# Altium project PGS-System.PrjPcb (part 4 of 16)

## Sheet BUCK_CONVERTER_SHEET1.SchDoc
size A4; SheetNumber: 3; SheetTotal: 27
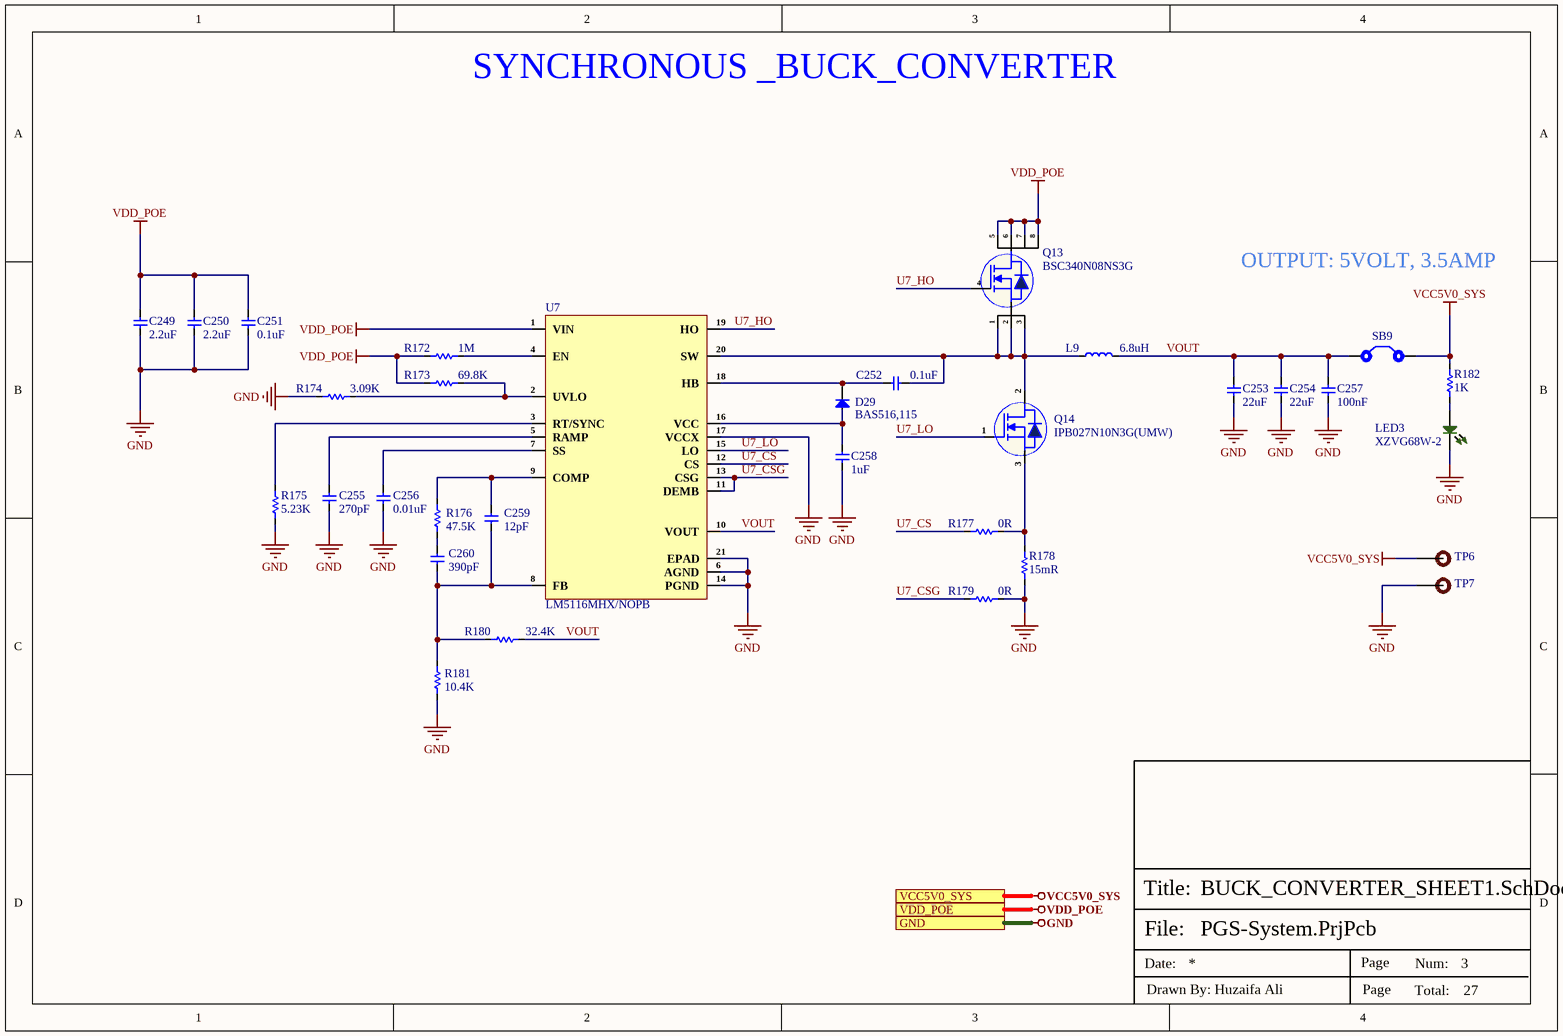
[diagram p2: BUCK_CONVERTER_SHEET1.SchDoc]

### Parts
C249  2.2uF  [Cap-0805]
C250  2.2uF  [Cap-0805]
C251  0.1uF  [Cap-0603]
C252  0.1uF  [Cap-0603]
C253  22uF  [Cap-0805]
C254  22uF  [Cap-0805]
C255  270pF  [Cap-0402]
C256  0.01uF  [Cap-0402]
C257  100nF  [CAP-0201]
C258  1uF  [Cap-0603]
C259  12pF  [Cap-0402]
C260  390pF  [Cap-0402]
D29  BAS516,115  [SOD-523]
L9  6.8uH  [IHLP3232DZER6R8M11]
LED3  XZVG68W-2  [LED-0402]
Q13  BSC340N08NS3G  [PG-TDSON-8]
Q14  IPB027N10N3G(UMW)  [TO-263]
R172  1M  [Res-0603]
R173  69.8K  [Res-0603]
R174  3.09K  [RES-0805]
R175  5.23K  [RES-0805]
R176  47.5K  [Res-0402]
R177  0R  [Res-0603]
R178  15mR  [Res-1206]
R179  0R  [Res-0603]
R180  32.4K  [RES-0805]
R181  10.4K  [RES-0805]
R182  1K  [Res-0402]
SB9  Solder Bridge_1206  [SOLDER BRIDGE-1206_]  (value not drawn)  (no BOM)
TP6  TEST POINT 0.5mm Dia  [Test-point - 0.5mm]  (value not drawn)  (no BOM)
TP7  TEST POINT 0.5mm Dia  [Test-point - 0.5mm]  (value not drawn)  (no BOM)
U7  LM5116MHX/NOPB  [20-HTSSOP]

### Ports
GND (see DDR3_SDRAM_SHEET[5D], DEBUG_UART_INTERFACE[3D], DIGITAL_MEMS_INTERFACE[3C], eMMC_INTERFACE[3D], ETH_PoE-PD_INTERFACE[4D], ETH_SWITCH_INTERFACE[5D], IR-CUT_LIGHT SENSOR_SHEET[3D], MIPI TO HDMI_MODULE[3D], MIPI-CSI_RXX_INTERFACE[3C], PoE_PSE_CONTROLLER[5D], POWER_LDO_SHEET[3D], POWER_PMIC_RK809_CODEC[3C], POWER_PMIC_RK809_DC DC[3D], POWER_PMIC_RK809_LDO[4C], POWER_PMIC_RK809_MGM[3D], RV1126_AUDIO_SHEET[3D], RV1126_DRAM_SHEET[4C], RV1126_eMMC_SPI-FLASH[3C], RV1126_ETHERNET_SHEET[3D], RV1126_OSC-PLL-PMUIO[3C], RV1126_POWER_SHEET[1D], RV1126_SARADC_SHEET[3C], RV1126_SDMMC_SHEET[3C], SPEARKER_INTERFACE_SHEET[3C], SPI_FLASH_INTERFACE[3D], USB2.0_DEBUG_UART[3D]), VCC5V0_SYS (see IR-CUT_LIGHT SENSOR_SHEET[3D], MIPI TO HDMI_MODULE[3D], POWER_LDO_SHEET[3D], POWER_PMIC_RK809_CODEC[3C], POWER_PMIC_RK809_DC DC[3D], POWER_PMIC_RK809_LDO[4C], POWER_PMIC_RK809_MGM[3D], RV1126_OSC-PLL-PMUIO[3C], USB2.0_DEBUG_UART[3D]), VDD_POE (see ETH_PoE-PD_INTERFACE[4D], PoE_PSE_CONTROLLER[5D])

### Nets
GND: C249.1 C250.1 C251.1 C253.1 C254.1 C255.1 C256.1 C257.1 C258.2 LED3.2 R174.1 R175.1 R178.1 R179.2 R181.1 TP7.1 U7.6(AGND) U7.14(PGND) U7.17(VCCX) U7.21(EPAD) ; port GND  [project net KSENSD]
VCC5V0_SYS: R182.2 SB9.2 TP6.1 ; port VCC5V0_SYS
VDD_POE: C249.2 C250.2 C251.2 Q13.5(D) Q13.6(D) Q13.7(D) Q13.8(D) R172.1 R173.1 U7.1(VIN) ; port VDD_POE
U7_CS: R177.1 U7.12(CS)
U7_CSG: R179.1 U7.11(DEMB) U7.13(CSG)
U7_HO: Q13.4(G) U7.19(HO)
U7_LO: Q14.1(G) U7.15(LO)
VOUT: C253.2 C254.2 C257.2 L9.2 R180.2 SB9.1 U7.10(VOUT)
NetC252_1: C252.1 D29.2(K) U7.18(HB)
NetC252_2: C252.2 L9.1 Q13.1(S) Q13.2(S) Q13.3(S) Q14.2(D) U7.20(SW)
NetC255_2: C255.2 U7.5(RAMP)
NetC256_2: C256.2 U7.7(SS)
NetC258_1: C258.1 D29.1(A) U7.16(VCC)
NetC259_1: C259.1 C260.1 R180.1 R181.2 U7.8(FB)
NetC259_2: C259.2 R176.2 U7.9(COMP)
NetC260_2: C260.2 R176.1
NetLED3_1: LED3.1 R182.1
NetQ14_3: Q14.3(S) R177.2 R178.2
NetR172_2: R172.2 U7.4(EN)
NetR173_2: R173.2 R174.2 U7.2(UVLO)
NetR175_2: R175.2 U7.3(RT/SYNC)

### Notes on the sheet
- SYNCHRONOUS _BUCK_CONVERTER
- OUTPUT: 5VOLT, 3.5AMP
- File:
- Title:
- Date:
- Page
- Num:
- Total:
- Drawn By: Huzaifa Ali

### Library data of the parts
C249 C250 = GRM21BD72A225KE01L: CAP CER 2.2UF 100V X7T 0805; Manufacturer: Murata; Item Type: Capacitor; Supplier 1: Digi-Key; Manufacturer Part Number: GRM21BD72A225KE01L; RoHS: No; Category: Ceramic Capacitors; Stock 1: 2439; Pricing 1: 1=0.55000, 10=0.38600, 50=0.29220, 100=0.25440, 500=0.18846, 1000=0.16020 (USD); RoHS Compliant: Yes; LCSC Part Number: C2981733; ComponentLink1Description: LCSC; ComponentLink1URL: https://www.lcsc.com/product-detail/Multilayer-Ceramic-Capacitors-MLCC-SMD-SMT_Murata-Electronics-GRM21BD72A225KE01L_C2981733.html; Supplier Part Number 1: 490-GRM21BD72A225KE01LCT-ND
C251 C252 = CC0603KRX7R0BB104: as C119 on sheet ETH_PoE-PD_INTERFACE; Supplier 1: Digi-Key; Manufacturer Part Number: CC0603KRX7R0BB104; RoHS: Yes; Category: Ceramic Capacitors; Stock 1: 60476; Pricing 1: 1=0.19000, 10=0.13500, 50=0.07680, 100=0.06370, 500=0.04466, 1000=0.03696 (USD); Mount: Surface Mount; Case/Package: 0603; Case Code (Metric): 1608; Case Code (Imperial): 0603; Weight: 7.1E-05oz; Min Operating Temperature: -55°C; Max Operating Temperature: 125°C; Package Quantity: 4000; Voltage Rating: 100V; Packaging: Tape and Reel; Dielectric: X7R; Termination: SMD/SMT; Resistor Type: Ceramic; Voltage Rating (DC): 100V; Series: CC; Length: 0.063inch; Width: 0.031inch; Thickness: 0.035inch; Depth: 0.8mm; Lead Free: Lead Free; RoHS Compliant: Yes; ComponentLink1URL: https://datasheet.ciiva.com/6277/mlccorderingcode-6277030.pdf?src-supplier=Digi-Key; ComponentLink1Description: https://datasheet.ciiva.com/6277/mlccorderingcode-6277030.pdf?src-supplier=Digi-Key; ComponentLink2URL: https://datasheet.ciiva.com/6277/mlccorderingcode-6277081.pdf?src-supplier=Digi-Key; ComponentLink2Description: https://datasheet.ciiva.com/6277/mlccorderingcode-6277081.pdf?src-supplier=Digi-Key; ComponentLink3URL: https://datasheet.ciiva.com/6277/mlccorderingcode-6277082.pdf?src-supplier=Digi-Key; ComponentLink3Description: https://datasheet.ciiva.com/6277/mlccorderingcode-6277082.pdf?src-supplier=Digi-Key; Supplier Part Number 1: 311-1523-1-ND; LCSC Part Number: C113803
C253 C254 = GRM21BR61E226ME44L: CAP CER 22UF 25V X5R 0805; Manufacturer: Murata; Material: Ceramic; Tolerance: 20%; Item Type: Capacitor; Supplier 1: Arrow Electronics; Manufacturer Part Number: GRM21BR61E226ME44L; RoHS: Yes; Category: Ceramic Capacitors; Stock 1: 21193; Pricing 1: 1=0.45930, 10=0.35000, 25=0.33950, 50=0.26910, 100=0.22090, 250=0.21320, 500=0.16760, 1000=0.14640, 3000=0.11710, 6000=0.10550, 15000=0.10450 (USD); Mount: Surface Mount; Case/Package: 0805; Case Code (Metric): 2012; Case Code (Imperial): 0805; Weight: 0.000335oz; Min Operating Temperature: -55°C; Max Operating Temperature: 85°C; Capacitance: 22uF; Voltage Rating: 25V; Packaging: Tape and Reel; Dielectric: X5R; Voltage: 25V; Termination: SMD/SMT; Resistor Type: Ceramic; Voltage Rating (DC): 25V; Package Quantity: 3000; Series: GRM; Construction: Flat; Length: 2mm; Width: 1.25mm; Height: 1.25mm; Thickness: 0.057inch; Depth: 1.25mm; REACH SVHC: No SVHC; Lead Free: Lead Free; RoHS Compliant: Yes; ComponentLink1URL: https://datasheet.ciiva.com/22787/1747471-22787265.pdf?src-supplier=Farnell; ComponentLink1Description: https://datasheet.ciiva.com/22787/1747471-22787265.pdf?src-supplier=Farnell; ComponentLink2URL: https://datasheet.ciiva.com/7719/1747471-7719095.pdf?src-supplier=Element14; ComponentLink2Description: https://datasheet.ciiva.com/7719/1747471-7719095.pdf?src-supplier=Element14; ComponentLink3URL: https://datasheet.ciiva.com/28584/1747471-28584199.pdf?src-supplier=Element14; ComponentLink3Description: https://datasheet.ciiva.com/28584/1747471-28584199.pdf?src-supplier=Element14; Supplier Part Number 1: GRM21BR61E226ME44L; LCSC Part Number: C86816
C255 = CC0402JRNPO9BN271: CAP CER 270PF 50V C0G/NPO 0402; Manufacturer: Yageo; Item Type: Capacitor; Supplier: Future Electronics; LCSC Part Number: C107003; Manufacturer Part Number: CC0402JRNPO9BN271; RoHS: Yes; Stock: 10000; Pricing: 10000=0.004, 40000=0.0038, 150000=0.0036, 250000=0.0035, 500000=0.0033 (USD); Halogen Free: 5694HalogenFree; ComponentLink1URL: http://www.mouser.com/ds/2/447/Yageo_UPY-GP_NP0_16V-to-50V_9-358835.pdf?src-supplier=Mouser; ComponentLink1Description: http://www.mouser.com/ds/2/447/Yageo_UPY-GP_NP0_16V-to-50V_9-358835.pdf?src-supplier=Mouser; ComponentLink2URL: http://www.yageo.com/documents/recent/UPY-GP_NP0_16V-to-50V_6.pdf?src-supplier=Avnet; ComponentLink2Description: http://www.yageo.com/documents/recent/UPY-GP_NP0_16V-to-50V_6.pdf?src-supplier=Avnet; ComponentLink3URL: https://datasheet.octopart.com/CC0402JRNPO9BN271-Yageo-datasheet-137875056.pdf?src-supplier=Newark; ComponentLink3Description: https://datasheet.octopart.com/CC0402JRNPO9BN271-Yageo-datasheet-137875056.pdf?src-supplier=Newark; ComponentLink4URL: http://www.yageo.com/documents/recent/UPY-GP_NP0_16V-to-50V_16.pdf?src-supplier=Digikey; ComponentLink4Description: http://www.yageo.com/documents/recent/UPY-GP_NP0_16V-to-50V_16.pdf?src-supplier=Digikey; ComponentLink5URL: http://www.yageo.com/exep/pages/download/literatures/ProductSelectionGuide%202014_Final_2.pdf?src-supplier=Digikey; ComponentLink5Description: http://www.yageo.com/exep/pages/download/literatures/ProductSelectionGuide%202014_Final_2.pdf?src-supplier=Digikey; ComponentLink6URL: https://datasheet.octopart.com/CC0402JRNPO9BN271-Yageo-datasheet-136957424.pdf?src-supplier=Future+Electronics; ComponentLink6Description: https://datasheet.octopart.com/CC0402JRNPO9BN271-Yageo-datasheet-136957424.pdf?src-supplier=Future+Electronics; ComponentLink7URL: https://www.verical.com/server-webapp/html/getDatasheet?partID=755863&src-supplier=Verical; ComponentLink7Description: https://www.verical.com/server-webapp/html/getDatasheet?partID=755863&src-supplier=Verical; ComponentLink8URL: http://www.yageo.com/documents/recent/UPY-GP_NP0_16V-to-50V_9.pdf?src-supplier=Future+Electronics; ComponentLink8Description: http://www.yageo.com/documents/recent/UPY-GP_NP0_16V-to-50V_9.pdf?src-supplier=Future+Electronics
C256 = CC0402KRX5R8BB103: CAP CER 10000PF 25V X5R 0402; Manufacturer: Yageo; Item Type: Capacitor; Supplier 1: Future Electronics; Manufacturer Part Number: CC0402KRX5R8BB103; RoHS: Yes; Category: Ceramic Capacitors; Stock 1: 140000; Pricing 1: 10000=0.00290, 40000=0.00270, 150000=0.00260, 250000=0.00250, 500000=0.00240 (USD); RoHS Compliant: Yes; Supplier Part Number 1: 2101932; LCSC Part Number: C576726; ComponentLink1Description: LCSC; ComponentLink1URL: https://www.lcsc.com/product-detail/Multilayer-Ceramic-Capacitors-MLCC-SMD-SMT_YAGEO-CC0402KRX5R8BB103_C576726.html
C257 = CC0201KRX5R6BB104: CAP CER 0.1UF 10V X5R 0201; Manufacturer: Yageo; Tolerance: 10%; Supplier 1: Mouser; Manufacturer Part Number: CC0201KRX5R6BB104; RoHS: Yes; Category: Ceramic Capacitors; Stock 1: 824403; Pricing 1: 1=0.10000, 10=0.02400, 50=0.02400, 100=0.01900, 1000=0.01100, 10000=0.00900 (USD); Mount: Surface Mount; Case/Package: 0201; Case Code (Imperial): 0201; Case Code (Metric): 0603; Weight: 6E-06oz; Min Operating Temperature: -55°C; Max Operating Temperature: 85°C; Capacitance: 100nF; Dielectric: X5R; Voltage Rating (DC): 10V; Packaging: Tape and Reel; Termination: SMD/SMT; Resistor Type: Ceramic; Voltage Rating: 10V; Series: CC; Construction: Flat; Length: 0.6mm; Width: 0.012inch; Height: 0.3mm; Thickness: 0.013inch; Depth: 0.3mm; Radiation Hardening: No; Lead Free: Lead Free; Halogen Free: Halogen Free; RoHS Compliant: Yes; ComponentLink1URL: https://datasheet.ciiva.com/11587/upy-gphc-x5r-4v-to-50v-12-11587190.pdf?src-supplier=Avnet; ComponentLink1Description: https://datasheet.ciiva.com/11587/upy-gphc-x5r-4v-to-50v-12-11587190.pdf?src-supplier=Avnet; Supplier Part Number 1: 603-CC201KRX5R6BB104; LCSC Part Number: C190183
C258 = CL10A105KB8NNNC: CAP CER 1UF 50V X5R 0603; Manufacturer: Samsung; Material: 4241ConductorMaterial; Tolerance: 10%; Item Type: Capacitor; Supplier: Avnet; Supplier Part Number: CL10A105KB8NNNC; Manufacturer Part Number: CL10A105KB8NNNC; RoHS: Yes; Category: Ceramic Capacitors; Stock: 780446; Pricing: 4000=0.01632, 8000=0.01595, 16000=0.01557, 24000=0.0152, 32000=0.01482 (USD); Mounting Technology: Surface Mount; Case/Package: 0603; Case Code (Metric): 1608; Case Code (Imperial): 0603; Min Operating Temperature: -55°C; Max Operating Temperature: 85°C; Packaging: Tape and Reel; Value: 1uF; Voltage Rating: 50V; Dielectric: X5R; Series: CL; Voltage Rating (DC): 50V; Length: 1.6mm; Depth: 0.8mm; Radiation Hardening: No; RoHS Compliant: Yes; ComponentLink1URL: https://datasheet.ciiva.com/26877/getdatasheetpartid-753736-26877879.pdf?src-supplier=Verical; ComponentLink1Description: https://datasheet.ciiva.com/26877/getdatasheetpartid-753736-26877879.pdf?src-supplier=Verical; LCSC Part Number: C15849
C259 = GJM1555C1H120GB01D: CAP CER 12PF 50V C0G/NP0 0402; Manufacturer: Murata; Tolerance: 2%; Dielectric: C0G; Supplier 1: Digi-Key; Manufacturer Part Number: GJM1555C1H120GB01D; RoHS: Yes; Category: Ceramic Capacitors; Stock 1: 266975; Pricing 1: 1=0.18000, 10=0.12600, 50=0.07560, 100=0.06390, 500=0.04370, 1000=0.03865, 2500=0.03698, 5000=0.03361 (USD); Mount: Surface Mount; Case/Package: 0402; Case Code (Imperial): 0402; Case Code (Metric): 1005; Min Operating Temperature: -55°C; Max Operating Temperature: 125°C; Capacitance: 12pF; Voltage Rating: 50V; Voltage Rating (DC): 50V; Packaging: Tape and Reel; Package Quantity: 10000; Termination: SMD/SMT; Series: GJM; Construction: Flat; Length: 1mm; Width: 0.5mm; Height: 0.5mm; Thickness: 0.022inch; Depth: 0.5mm; Radiation Hardening: No; Lead Free: Lead Free; RoHS Compliant: Yes; ComponentLink1URL: https://datasheet.ciiva.com/11608/product-11608208.pdf?src-supplier=Avnet; ComponentLink1Description: https://datasheet.ciiva.com/11608/product-11608208.pdf?src-supplier=Avnet; ComponentLink2URL: https://datasheet.ciiva.com/29542/partnumbering-e-01-29542716.pdf?src-supplier=Digi-Key; ComponentLink2Description: https://datasheet.ciiva.com/29542/partnumbering-e-01-29542716.pdf?src-supplier=Digi-Key; ComponentLink3URL: https://datasheet.ciiva.com/29542/partnumbering-e-01-29542715.pdf?src-supplier=Digi-Key; ComponentLink3Description: https://datasheet.ciiva.com/29542/partnumbering-e-01-29542715.pdf?src-supplier=Digi-Key; ComponentLink4URL: https://datasheet.ciiva.com/29542/partnumbering-e-01-29542717.pdf?src-supplier=Digi-Key; ComponentLink4Description: https://datasheet.ciiva.com/29542/partnumbering-e-01-29542717.pdf?src-supplier=Digi-Key; Supplier Part Number 1: 490-8078-1-ND; LCSC Part Number: C161305
C260 = CGA2B2C0G1H391J050BA: CAP CER 390PF 50V C0G 0402; Manufacturer: TDK; Item Type: Capacitors; Supplier: Digikey; Supplier Part Number: 445-5603-1-ND; Manufacturer Part Number: CGA2B2C0G1H391J050BA; RoHS: Yes; Stock: 103846; Pricing: 1=0.1, 10=0.048, 50=0.0278, 100=0.0216, 500=0.01622, 1000=0.01275, 2500=0.01159, 5000=0.01066 (USD); ComponentLink1URL: https://datasheet.ciiva.com/24219/cga2b2c0g1h391j050ba-265720-24219960.pdf?src-supplier=Mouser; ComponentLink1Description: https://datasheet.ciiva.com/24219/cga2b2c0g1h391j050ba-265720-24219960.pdf?src-supplier=Mouser; ComponentLink2URL: https://datasheet.ciiva.com/7975/1807242-7975259.pdf?src-supplier=Element14; ComponentLink2Description: https://datasheet.ciiva.com/7975/1807242-7975259.pdf?src-supplier=Element14
D29 = BAS516,115: DIODE GEN PURP 100V 250MA SOD523; Manufacturer: Nexperia; Max Reverse Current: 50uA; Max Forward Surge Current (Ifsm): 4A; Value: 1pF; Supplier: Future Electronics; LCSC Part Number: C10037; Manufacturer Part Number: BAS516,115; RoHS: Yes; Item Type: Diode; Stock: 4176000; Pricing: 3000=0.0153, 12000=0.0146, 30000=0.0142, 75000=0.0138, 120000=0.0132 (USD); Pins: 2NUMBER; Max Repetitive Reverse Voltage (Vrrm): 100V; Forward Current: 250mA; Reverse Voltage: 100V; Height: 650um; RoHS Compliant: Yes; ComponentLink1URL: http://www.farnell.com/datasheets/1856332.pdf?src-supplier=Farnell; ComponentLink1Description: http://www.farnell.com/datasheets/1856332.pdf?src-supplier=Farnell; ComponentLink2URL: https://datasheet.octopart.com/BAS516%2C115-Nexperia-datasheet-32749520.pdf?src-supplier=Newark; ComponentLink2Description: https://datasheet.octopart.com/BAS516%2C115-Nexperia-datasheet-32749520.pdf?src-supplier=Newark; ComponentLink3URL: https://assets.nexperia.com/documents/data-sheet/BAS16_SER.pdf?src-supplier=Digikey; ComponentLink3Description: https://assets.nexperia.com/documents/data-sheet/BAS16_SER.pdf?src-supplier=Digikey; ComponentLink4URL: https://datasheet.octopart.com/BAS516%2C115-Nexperia-datasheet-81455687.pdf?src-supplier=TME; ComponentLink4Description: https://datasheet.octopart.com/BAS516%2C115-Nexperia-datasheet-81455687.pdf?src-supplier=TME
L9 = IHLP3232DZER6R8M11: FIXED IND 6.8UH 7A 33.4 MOHM SMD; Manufacturer: Vishay Dale; Item Type: Inductor; Core Material: Ferrite; Inductance Tolerance: 20%; Self Resonant Frequency: 13MHz; Shielding: Shielded; Saturation Current: 6.7A; DC Resistance (DCR): 33.4mR; Test Frequency: 100kHz; Supplier: Mouser; LCSC Part Number: C845060; Manufacturer Part Number: IHLP3232DZER6R8M11; RoHS: Yes; Stock: 8806; Pricing: 1=1.31, 10=0.984, 50=0.984, 100=0.752, 1000=0.557, 10000=0.521 (USD); Mounting Technology: Surface Mount; Case/Package: 3232; Pins: 2; Min Operating Temperature: -55°C; Max Operating Temperature: 125°C; Package Quantity: 500; Packaging: Tape and Reel; Tolerance: 20%; Current Rating: 7A; Value: 6.8uH; Max DC Current: 6.7A; Termination: SMD/SMT; RMS Current (Irms): 7A; Series: IHLP-3232DZ-11; Max Current Rating: 7A; Length: 0.34inch; Width: 0.322inch; Height: 4mm; Height - Seated (Max): 0.157inch; Depth: 8.94mm; Radiation Hardening: No; Military Standard: Not; Lead Free: Lead Free; RoHS Compliant: Yes; Reach SVHC Compliant: Unknown; ComponentLink1URL: https://datasheet.ciiva.com/5763/ihlp3232dz11-5763504.pdf?src-supplier=Farnell; ComponentLink1Description: https://datasheet.ciiva.com/5763/ihlp3232dz11-5763504.pdf?src-supplier=Farnell; ComponentLink2URL: https://datasheet.ciiva.com/1058/ihlp-3232dz-11-1058078.pdf?src-supplier=Digikey; ComponentLink2Description: https://datasheet.ciiva.com/1058/ihlp-3232dz-11-1058078.pdf?src-supplier=Digikey; ComponentLink3URL: https://datasheet.ciiva.com/1058/ihlp-3232dz-11-1058077.pdf?src-supplier=Digikey; ComponentLink3Description: https://datasheet.ciiva.com/1058/ihlp-3232dz-11-1058077.pdf?src-supplier=Digikey; ComponentLink4URL: https://datasheet.ciiva.com/1058/ihlp-3232dz-11-1058079.pdf?src-supplier=Digikey; ComponentLink4Description: https://datasheet.ciiva.com/1058/ihlp-3232dz-11-1058079.pdf?src-supplier=Digikey; ComponentLink5URL: https://datasheet.ciiva.com/8495/ihlp3232dz11-8495151.pdf?src-supplier=Avnet; ComponentLink5Description: https://datasheet.ciiva.com/8495/ihlp3232dz11-8495151.pdf?src-supplier=Avnet; ComponentLink6URL: https://datasheet.ciiva.com/8017/ihlp3232dz11-8017326.pdf?src-supplier=Element14; ComponentLink6Description: https://datasheet.ciiva.com/8017/ihlp3232dz11-8017326.pdf?src-supplier=Element14
LED3 = XZVG68W-2: LED GREEN CLEAR CHIP SMD; Manufacturer: SunLED; Lens Color: Colorless; Luminous Intensity: 49mcd; Test Current: 20mA; Viewing Angle: 120°; Dominant Wavelength: 570nm; Forward Voltage: 2.1V; Supplier 1: Digi-Key; Manufacturer Part Number: XZVG68W-2; Stock 1: 4185; Pricing 1: 1=0.5, 10=0.36, 100=0.16, 500=0.112, 1000=0.092 (USD); Mount: Surface Mount; Case/Package: 0402; Color: Green; Case Code (Metric): 1005; Case Code (Imperial): 0402; Packaging: Tape and Reel; Lens Transparency: Clear; Length: 1mm; Height: 0.6mm; Width: 0.5mm; ComponentLink1URL: http://www.sunledusa.com/products/spec/XZVG68W-2.pdf?src-supplier=Digi-Key; ComponentLink1Description: http://www.sunledusa.com/products/spec/XZVG68W-2.pdf?src-supplier=Digi-Key; ComponentLink2URL: https://www.sunledusa.com/products/spec/XZVG68W-2.pdf?src-supplier=Digi-Key; ComponentLink2Description: https://www.sunledusa.com/products/spec/XZVG68W-2.pdf?src-supplier=Digi-Key; Supplier Part Number 1: 1497-1219-6-ND; Item Type: LED
Q13 = BSC340N08NS3G: MOSFET N-CH 80V 7A/23A TDSON-8-5; Manufacturer: Infineon; Input Capacitance: 756pF; Max Power Dissipation: 32W; Rds On Max: 34mR; Continuous Drain Current (ID): 23A; Rise Time: 3ns; Turn-Off Delay Time: 11ns; Turn-On Delay Time: 8ns; Fall Time: 2ns; Gate to Source Voltage (Vgs): 20V; Supplier: Future Electronics; LCSC Part Number: C83511; Manufacturer Part Number: BSC340N08NS3G; RoHS: Yes; Stock: 70000; Pricing: 5000=0.235, 10000=0.23, 15000=0.225, 20000=0.225, 25000=0.22 (USD); Pins: 8; Min Operating Temperature: -55°C; Max Operating Temperature: 150°C; Packaging: Tape and Reel; Drain to Source Voltage (Vdss): 80V; Package Quantity: 1; Series: OptiMOS™; Length: 5.35mm; Width: 6.1mm; Height: 1.1mm; Halogen Free: Halogen Free; Lead Free: Lead Free; RoHS Compliant: Yes; ComponentLink1URL: https://datasheet.ciiva.com/951/infineon-bsc340n08ns3g-ds-v02-06-en-951160.pdf?src-supplier=Digikey; ComponentLink1Description: https://datasheet.ciiva.com/951/infineon-bsc340n08ns3g-ds-v02-06-en-951160.pdf?src-supplier=Digikey; Item Type: MOSFET
Q14 = IPB027N10N3G(UMW): TO-263 MOSFETs ROHS; Item Type: MOSFET; Manufacturer: UMW; Manufacturer Part Number: IPB027N10N3G(UMW); Package: TO-263; LCSC Part Number: C19185922; ComponentLink1Description: LCSC; ComponentLink1URL: https://www.lcsc.com/product-detail/MOSFETs_UMW-Youtai-Semiconductor-Co-Ltd-IPB027N10N3G-UMW_C19185922.html
R172 = RC0603FR-071ML: RES SMD 1M OHM 1% 1/10W 0603; Manufacturer: Yageo; Voltage Rating: 50V; Resistance: 1MR; Power Rating: 100mW; Temperature Coefficient: 100ppm/°C; Item Type: Resistor; Supplier 1: Digi-Key; Manufacturer Part Number: RC0603FR-071ML; Stock 1: 3824601; Pricing 1: 1=0.1, 10=0.023, 100=0.0094, 1000=0.00421, 2500=0.00366 (USD); Case/Package: 0603; Number of Pins: 2; Case Code (Imperial): 0603; Case Code (Metric): 1608; Min Operating Temperature: -55°C; Max Operating Temperature: 155°C; Voltage Rating (DC): 50V; Tolerance: 1%; Packaging: Tape and Reel; Package Quantity: 5000; Termination: SMD/SMT; Composition: Thick Film; Military Standard: Not; Length: 1.6mm; Height: 0.45mm; Width: 0.8mm; Depth: 0.8mm; REACH SVHC: No SVHC; Lead Free: Lead Free; ComponentLink1URL: http://www.farnell.com/datasheets/2167052.pdf?src-supplier=Mouser; ComponentLink1Description: http://www.farnell.com/datasheets/2167052.pdf?src-supplier=Mouser; ComponentLink2URL: http://www.farnell.com/datasheets/2167052.pdf?src-supplier=Element14; ComponentLink2Description: http://www.farnell.com/datasheets/2167052.pdf?src-supplier=Element14; ComponentLink3URL: http://documents.rs-components.com/techlib://itc_doclist_GB.htm?stockno=5048956&src-supplier=RSComponents; ComponentLink3Description: http://documents.rs-components.com/techlib://itc_doclist_GB.htm?stockno=5048956&src-supplier=RSComponents; Supplier Part Number 1: 311-1.00MHRDKR-ND; LCSC Part Number: C105578
R173 = SCR0603F69K8: 100mW Thick Film Resistors 75V ±1% 69.8kΩ 0603 Chip Resistor - Surface Mount ROHS; Manufacturer: VO; Manufacturer Part Number: SCR0603F69K8; Package: 0603; LCSC Part Number: C3016381; Item Type: Resistor; ComponentLink1Description: LCSC; ComponentLink1URL: https://www.lcsc.com/product-detail/Chip-Resistor-Surface-Mount_VO-SCR0603F69K8_C3016381.html
R174 = RC0805FR-073K09L: RES 3.09K OHM 1% 1/8W 0805; Manufacturer: Yageo; Item Type: Resistor; Supplier: Avnet; LCSC Part Number: C274002; Manufacturer Part Number: RC0805FR-073K09L; RoHS: Yes; Stock: 2965; Pricing: 1=0.104, 25=0.017, 50=0.014, 100=0.01 (USD); ComponentLink1URL: https://datasheet.ciiva.com/2457/pyu-r-int-thick-7-2457866.pdf?src-supplier=Digikey; ComponentLink1Description: https://datasheet.ciiva.com/2457/pyu-r-int-thick-7-2457866.pdf?src-supplier=Digikey; ComponentLink2URL: https://datasheet.ciiva.com/2457/pyu-r-int-thick-7-2457867.pdf?src-supplier=Digikey; ComponentLink2Description: https://datasheet.ciiva.com/2457/pyu-r-int-thick-7-2457867.pdf?src-supplier=Digikey; ComponentLink3URL: https://datasheet.ciiva.com/2457/pyu-r-int-thick-7-2457868.pdf?src-supplier=Digikey; ComponentLink3Description: https://datasheet.ciiva.com/2457/pyu-r-int-thick-7-2457868.pdf?src-supplier=Digikey; ComponentLink4URL: https://datasheet.ciiva.com/12577/rc0805-12577606.pdf?src-supplier=Mouser; ComponentLink4Description: https://datasheet.ciiva.com/12577/rc0805-12577606.pdf?src-supplier=Mouser; ComponentLink5URL: https://datasheet.ciiva.com/17196/rc0805-17196072.pdf?src-supplier=Future+Electronics; ComponentLink5Description: https://datasheet.ciiva.com/17196/rc0805-17196072.pdf?src-supplier=Future+Electronics
R175 = RC0805FR-075K23L: RES 5.23K OHM 1% 1/8W 0805; Manufacturer: Yageo; Item Type: Resistor; Supplier: Future Electronics; LCSC Part Number: C274009; Manufacturer Part Number: RC0805FR-075K23L; RoHS: Yes; Stock: 5000; Pricing: 5000=0.0024, 25000=0.0023, 100000=0.0021, 250000=0.0021, 625000=0.0019 (USD); ComponentLink1URL: https://datasheet.ciiva.com/12577/rc0805-12577289.pdf?src-supplier=Mouser; ComponentLink1Description: https://datasheet.ciiva.com/12577/rc0805-12577289.pdf?src-supplier=Mouser
R176 = 0402WGF4752TCE: 62.5mW Thick Film Resistors 50V ±100ppm/℃ ±1% 47.5kΩ 0402 Chip Resistor - Surface Mount ROHS; Manufacturer: Uniroyal; Supplier: LCSC; LCSC Part Number: C25896; Manufacturer Part Number: 0402WGF4752TCE; RoHS: No; Item Type: Resistor
R177 R179 = RC0603JR-070RL: RES 0 OHM JUMPER 1/10W 0603; Manufacturer: Yageo; Resistance: 0mR; Tolerance: 1%; Power Rating: 100mW; Voltage Rating (DC): 50V; Temperature Coefficient: 200ppm/°C; Resistance Tolerance: 5%; Item Type: Resistor; Supplier 1: Digi-Key; Manufacturer Part Number: RC0603JR-070RL; RoHS: Yes; Category: Chip SMD Resistors; Stock 1: 18081776; Pricing 1: 1=0.10000, 10=0.01700, 25=0.01240, 50=0.00960, 100=0.00700, 250=0.00536, 500=0.00430, 1000=0.00316 (USD); Case/Package: 0603; Number of Pins: 2; Contact Plating: Tin,Matte; Case Code (Imperial): 0603; Case Code (Metric): 1608; Size Code: 0603; Min Operating Temperature: -55°C; Max Operating Temperature: 155°C; Resistor Type: Thick Film; Packaging: Tape and Reel; Termination: SMD/SMT; Series: RC; Technology: THICK FILM; Package Quantity: 5000; Voltage Rating: 50V; Features: Moisture Resistant; Max Power Dissipation: 100mW; Number of Terminations: 2; Construction: Rectangular; Length: 1.6mm; Width: 0.8mm; Height: 0.45mm; Depth: 0.8mm; Radiation Hardening: No; Reach SVHC Compliant: No SVHC; Lead Free: Lead Free; RoHS Compliant: Yes; Military Standard: Not; Supplier Part Number 1: 311-0.0GRCT-ND; LCSC Part Number: C95177
R178 = WSLP1206R0150FEA: RES 0.015 OHM 1% 1W 1206; Manufacturer: Vishay Dale; Item Type: Resistor; Supplier: Mouser; LCSC Part Number: C844911; Manufacturer Part Number: WSLP1206R0150FEA; RoHS: Yes; Stock: 4766; Pricing: 1=0.68, 10=0.436, 50=0.436, 100=0.339, 1000=0.222, 10000=0.191 (USD); Lead Free: 5697LeadFree; ComponentLink1URL: https://datasheet.ciiva.com/2503/wslp-2503933.pdf?src-supplier=Digikey; ComponentLink1Description: https://datasheet.ciiva.com/2503/wslp-2503933.pdf?src-supplier=Digikey; ComponentLink2URL: https://datasheet.ciiva.com/2503/wslp-2503935.pdf?src-supplier=Digikey; ComponentLink2Description: https://datasheet.ciiva.com/2503/wslp-2503935.pdf?src-supplier=Digikey; ComponentLink3URL: https://datasheet.ciiva.com/2503/wslp-2503934.pdf?src-supplier=Digikey; ComponentLink3Description: https://datasheet.ciiva.com/2503/wslp-2503934.pdf?src-supplier=Digikey
R180 = RT0805BRD0732K4L: RES SMD 32.4K OHM 0.1% 1/8W 0805; Manufacturer: Yageo; Item Type: Resistor; Value: 32.4kR; Power Rating: 125mW; Voltage Rating: 150V; Temperature Coefficient: 25ppm/°C; Supplier: Digikey; LCSC Part Number: C865406; Manufacturer Part Number: RT0805BRD0732K4L; RoHS: Yes; Stock: 3825; Pricing: 1=0.16, 10=0.12, 50=0.0946, 100=0.0846, 500=0.06418, 1000=0.05663 (USD); Case/Package: 0805; Case Code (Metric): 2012; Case Code (Imperial): 0805; Min Operating Temperature: -55°C; Max Operating Temperature: 155°C; Tolerance: 0.1%; Packaging: Tape and Reel; Number of Terminations: 2; Termination: SMD/SMT; Max Power Dissipation: 125mW; Voltage Rating (DC): 150V; Features: Moisture Resistant; Series: RT; Length: 0.079inch; Width: 0.049inch; Height: 0.024inch; Lead Free: Lead Free; RoHS Compliant: Yes; ComponentLink1URL: https://datasheet.ciiva.com/12703/pyu-rt-1-to-0-05-rohs-l-4-12703893.pdf?src-supplier=Mouser; ComponentLink1Description: https://datasheet.ciiva.com/12703/pyu-rt-1-to-0-05-rohs-l-4-12703893.pdf?src-supplier=Mouser
R181 = RT0805BRD0710K4L: RES SMD 10.4K OHM 0.1% 1/8W 0805; Manufacturer: Yageo; Item Type: Resistors; Voltage Rating: 150V; Value: 10.4kR; Power Rating: 125mW; Temperature Coefficient: 25ppm/°C; Supplier: Digikey; LCSC Part Number: C865135; Manufacturer Part Number: RT0805BRD0710K4L; RoHS: Yes; Stock: 8595; Pricing: 1=0.16, 10=0.12, 50=0.0946, 100=0.0846, 500=0.06418, 1000=0.05663 (USD); Case/Package: 0805; Case Code (Metric): 2012; Case Code (Imperial): 0805; Min Operating Temperature: -55°C; Max Operating Temperature: 155°C; Tolerance: 0.1%; Packaging: Tape and Reel; Termination: SMD/SMT; Number of Terminations: 2; Max Power Dissipation: 125mW; Series: RT; RoHS Compliant: Yes; ComponentLink1URL: http://www.mouser.com/ds/2/447/yageodocoutput-1125656.pdf?src-supplier=Mouser; ComponentLink1Description: http://www.mouser.com/ds/2/447/yageodocoutput-1125656.pdf?src-supplier=Mouser; ComponentLink2URL: http://www.yageo.com/documents/recent/PYu-RT_1-to-0.01_RoHS_L_9.pdf?src-supplier=Digikey; ComponentLink2Description: http://www.yageo.com/documents/recent/PYu-RT_1-to-0.01_RoHS_L_9.pdf?src-supplier=Digikey
R182 = CRCW04021K00FKEDHP: RES SMD 1K OHM 1% 1/5W 0402; Manufacturer: Vishay Dale; Resistance: 1kR; Temperature Coefficient: 100ppm/°C; Power Rating: 125mW; Voltage Rating: 50V; Supplier 1: Digi-Key; Manufacturer Part Number: CRCW04021K00FKEDHP; Stock 1: 315989; Pricing 1: 1=0.15, 10=0.132, 100=0.0506, 1000=0.02226, 2500=0.01923, 5000=0.0172 (USD); Mount: Surface Mount; Case/Package: 0402; Number of Pins: 2; Contact Plating: Tin; Weight: 2.3E-05oz; Case Code (Imperial): 0402; Case Code (Metric): 1005; Size Code: 0402; Min Operating Temperature: -55°C; Max Operating Temperature: 155°C; Tolerance: 1%; Resistor Type: Thick Film; Package Quantity: 10; Packaging: Tape and Reel; Number of Terminations: 2; Termination: SMD/SMT; Max Power Dissipation: 125mW; Voltage Rating (DC): 50V; Features: Automotive AEC-Q200; Series: CRCW-HP; Construction: Rectangular; Technology: THICK FILM; Resistance Tolerance: 1%; Length: 1mm; Width: 0.5mm; Height: 0.3mm; Depth: 0.5mm; Radiation Hardening: No; REACH SVHC: Unknown; Military Standard: Not; Lead Free: Lead Free; RoHS Compliant: Yes; ComponentLink1URL: http://www.farnell.com/datasheets/2339608.pdf?src-supplier=Element14; ComponentLink1Description: http://www.farnell.com/datasheets/2339608.pdf?src-supplier=Element14; ComponentLink2URL: http://www.vishay.com/docs/20043/crcwhpe3.pdf?src-supplier=Digi-Key; ComponentLink2Description: http://www.vishay.com/docs/20043/crcwhpe3.pdf?src-supplier=Digi-Key; ComponentLink3URL: http://www.mouser.com/ds/2/427/crcwhpe3-46056.pdf?src-supplier=Mouser; ComponentLink3Description: http://www.mouser.com/ds/2/427/crcwhpe3-46056.pdf?src-supplier=Mouser; ComponentLink4URL: http://www.vishay.com/docs/20043/crcwhpe3.pdf?src-supplier=Avnet; ComponentLink4Description: http://www.vishay.com/docs/20043/crcwhpe3.pdf?src-supplier=Avnet; ComponentLink5URL: http://www.vishay.com/docs/20043/crcwhpe3.pdf?src-supplier=Future+Electronics; ComponentLink5Description: http://www.vishay.com/docs/20043/crcwhpe3.pdf?src-supplier=Future+Electronics; Supplier Part Number 1: 541-1.00KYCT-ND; LCSC Part Number: C313354
SB9 = Solder Bridge_1206: Solder Bridge ON; Manufacturer Part Number: Solder Bridge_1206; Item Type: Solder Bridge
TP6 TP7 = TEST POINT 0.5mm Dia: Test Point ON; Item Type: Test Point; Manufacturer Part Number: TEST POINT 0.5mm Dia
U7 = LM5116MHX/NOPB: IC REG CTRLR BUCK 20TSSOP; Manufacturer: TI National Semiconductor; Number of Channels: 1NUMBER; Max Duty Cycle: 98%; Supplier: Mouser; LCSC Part Number: C13755; Manufacturer Part Number: LM5116MHX/NOPB; RoHS: Yes; Item Type: IC; Stock: 9134; Pricing: 1=6.26, 10=5.3, 50=5.3, 100=4.59, 1000=3.26, 10000=3.14 (USD); Length: 6.5mm; Height: 1.2mm; Lead Free: 5697LeadFree; ComponentLink1URL: https://datasheet.ciiva.com/3217/lm5116-3217294.pdf?src-supplier=Avnet; ComponentLink1Description: https://datasheet.ciiva.com/3217/lm5116-3217294.pdf?src-supplier=Avnet; ComponentLink2URL: https://datasheet.ciiva.com/6596/lm5116-6596552.pdf?src-supplier=Digikey; ComponentLink2Description: https://datasheet.ciiva.com/6596/lm5116-6596552.pdf?src-supplier=Digikey; ComponentLink3URL: https://datasheet.ciiva.com/6596/lm5116-6596553.pdf?src-supplier=Digikey; ComponentLink3Description: https://datasheet.ciiva.com/6596/lm5116-6596553.pdf?src-supplier=Digikey; ComponentLink4URL: https://datasheet.ciiva.com/6596/lm5116-6596565.pdf?src-supplier=Digikey; ComponentLink4Description: https://datasheet.ciiva.com/6596/lm5116-6596565.pdf?src-supplier=Digikey